# Altium schematic sheet starfish_0.SchDoc: starfish
size 282 x 208 mm; Origin: Eagle; Date: 4/18/2022 11:53:22 PM; SheetNumber: 1; GateName_1: G$1; SymbolName_1: A4L-LOC; LibraryName: frames; DeviceSetName: A4L-LOC; Sheet: Sheet:
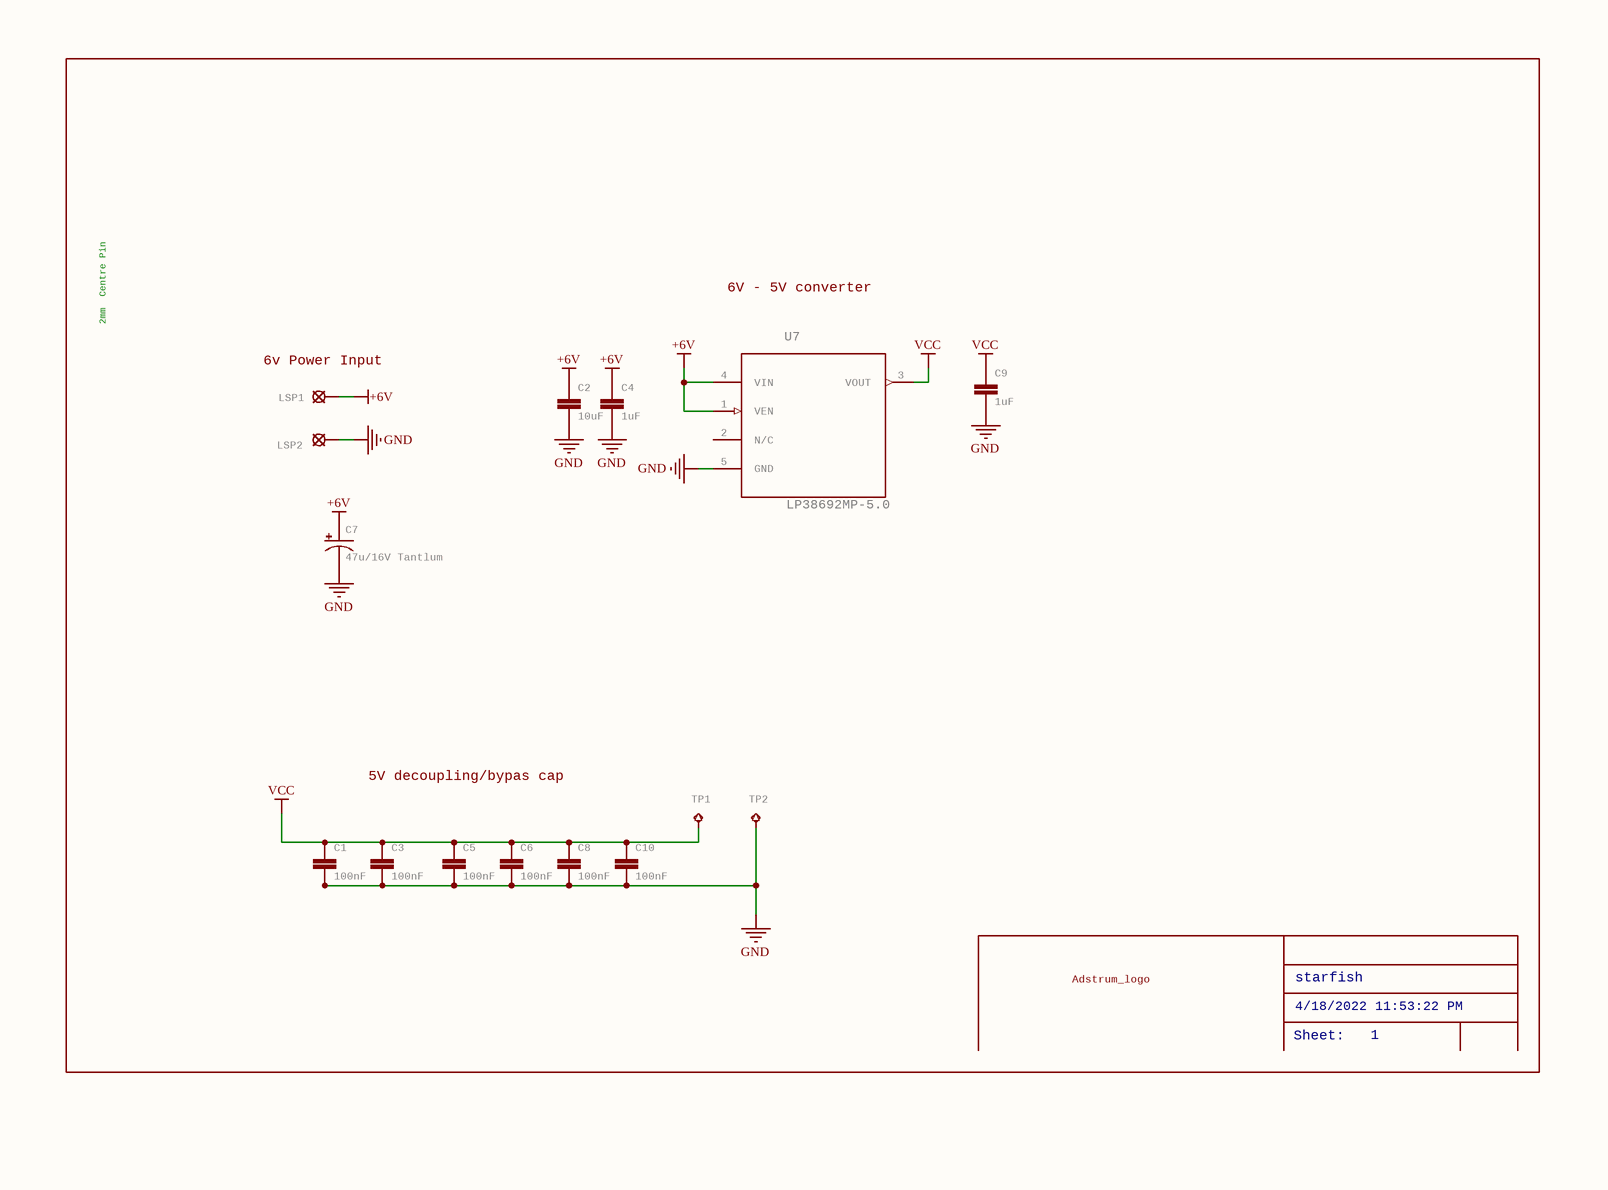
[diagram p0: starfish_0.SchDoc]

## Parts
C1  100nF  [C1210]
C2  10uF  [C0805]
C3  100nF  [C0603]
C4  1uF  [C0805]
C5  100nF  [C0603]
C6  100nF  [C0603]
C7  47u/16V Tantlum  [C/6032-28R]
C8  100nF  [C0603]
C9  1uF  [C0805]
C10  100nF  [C0603]
LSP1  LSP10  [LSP10]  (value not drawn)
LSP2  LSP10  [LSP10]  (value not drawn)
TP1  vcc  [B1,27]  (value not drawn)
TP2  gnd  [B1,27]  (value not drawn)
U7  LP38692MP-5.0  [SOT150P696X180-5N]
U$16  ADSTRUM_LOGO  [ADSTRUM_LOGO]

## Nets
+6V: C2.1 C4.1 C7.+ LSP1.MP U7.1(VEN) U7.4(VIN)
GND: C1.2 C2.2 C3.2 C4.2 C5.2 C6.2 C7.- C8.2 C9.2 C10.2 LSP2.MP TP2.TP U7.5(GND)
VCC: C1.1 C3.1 C5.1 C6.1 C8.1 C9.1 C10.1 TP1.TP U7.3(VOUT)

Not connected (* = marked no-connect by the designer): U7 2(N/C)

## Notes on the sheet
- 2mm  Centre Pin
- 6V - 5V converter
- (near LSP1) 6v Power Input
- 5V decoupling/bypas cap
- starfish
- Sheet:
- 4/18/2022 11:53:22 PM
- 1

## Library data of the parts
C1 = C-EUC1210: CAPACITOR, European symbol; GateName_1: G$1; SymbolName_1: C-EU; DeviceName: C1210; LibraryName: resistor; DeviceSetName: C-EU
C2 C4 C9 = C-EUC0805: CAPACITOR, European symbol; GateName_1: G$1; SymbolName_1: C-EU; DeviceName: C0805; LibraryName: resistor; DeviceSetName: C-EU
C3 C5 C6 C8 C10 = C-EUC0603: CAPACITOR, European symbol; GateName_1: G$1; SymbolName_1: C-EU; DeviceName: C0603; LibraryName: resistor; DeviceSetName: C-EU
C7 = CPOL-USC/6032-28R: POLARIZED CAPACITOR, American symbol; GateName_1: G$1; POPULARITY: 0; SymbolName_1: CPOL-US; DeviceName: C/6032-28R; LibraryName: rcl; DeviceSetName: CPOL-US; SPICEPREFIX: C
LSP1 LSP2 = LSP10: SOLDER PAD    drill 1.0 mm, distributor Buerklin, 12H555; GateName_1: 1; SymbolName_1: LSP; POPULARITY: 52; LibraryName: solpad; DeviceSetName: LSP10
TP1 TP2 = TPB1,27: Test pad; GateName_1: G$1; SymbolName_1: TP; POPULARITY: 19; DeviceName: B1,27; LibraryName: testpad; DeviceSetName: TP
U7 = LP38692MP-5.0: Linear  Regulator Check availability; GateName_1: A; DESCRIPTION: 1-A, 10-V, low-dropout voltage regulator with enable; MF: Texas Instruments; MP: LP38692MP-5.0/NOPB; SymbolName_1: LP38692MP-5.0; LibraryName: LP38692MP-5.0; DeviceSetName: LP38692MP-5.0; AVAILABILITY: In Stock; PACKAGE: SOT-223-5 Texas Instruments; PRICE: None; PURCHASE-URL: https://pricing.snapeda.com/search/part/LP38692MP-5.0/NOPB/?ref=eda
U$16 = ADSTRUM_LOGO: ADSTRUM LOGO; GateName_1: G$1; SymbolName_1: ADSTRUM_LOGO; LibraryName: ADSTRUM_LOGO; DeviceSetName: ADSTRUM_LOGO; Adstrum_logo: Adstrum_logo